# Altium schematic sheet Top-Sheet.SchDoc
size A4; SheetNumber: 1; SheetTotal: 3
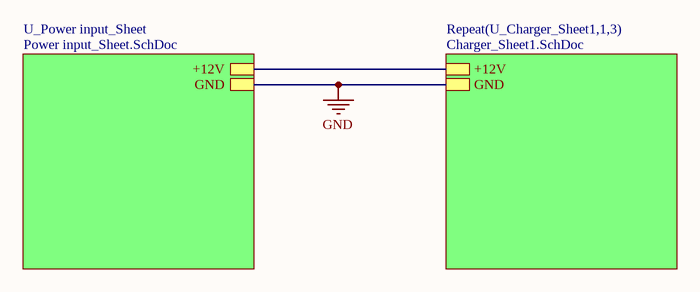
[diagram p0: Top-Sheet.SchDoc]

## Sub-sheets
Repeat(U_Charger_Sheet1,1,3) = Charger_Sheet1.SchDoc: +12V, GND
U_Power input_Sheet = Power input_Sheet.SchDoc: +12V, GND

## Nets
GND: sheet U_Power input_Sheet/GND, sheet Repeat(U_Charger_Sheet1,1,3)/GND
(unnamed): sheet U_Power input_Sheet/+12V, sheet Repeat(U_Charger_Sheet1,1,3)/+12V

## Notes on the sheet
- File:
- Title:
- Date:
- Page
- Num:
- Total:
- Drawn By: Huzaifa Ali